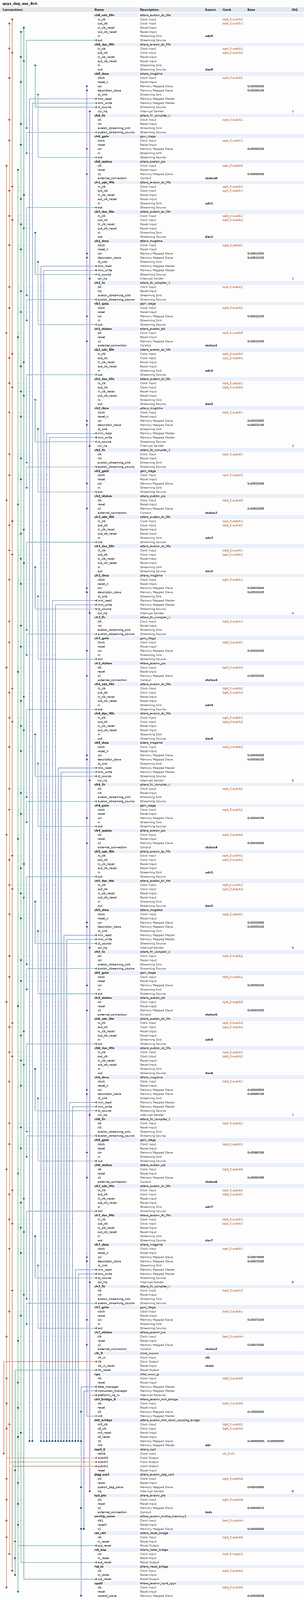
[diagram p0: system contents, whole]
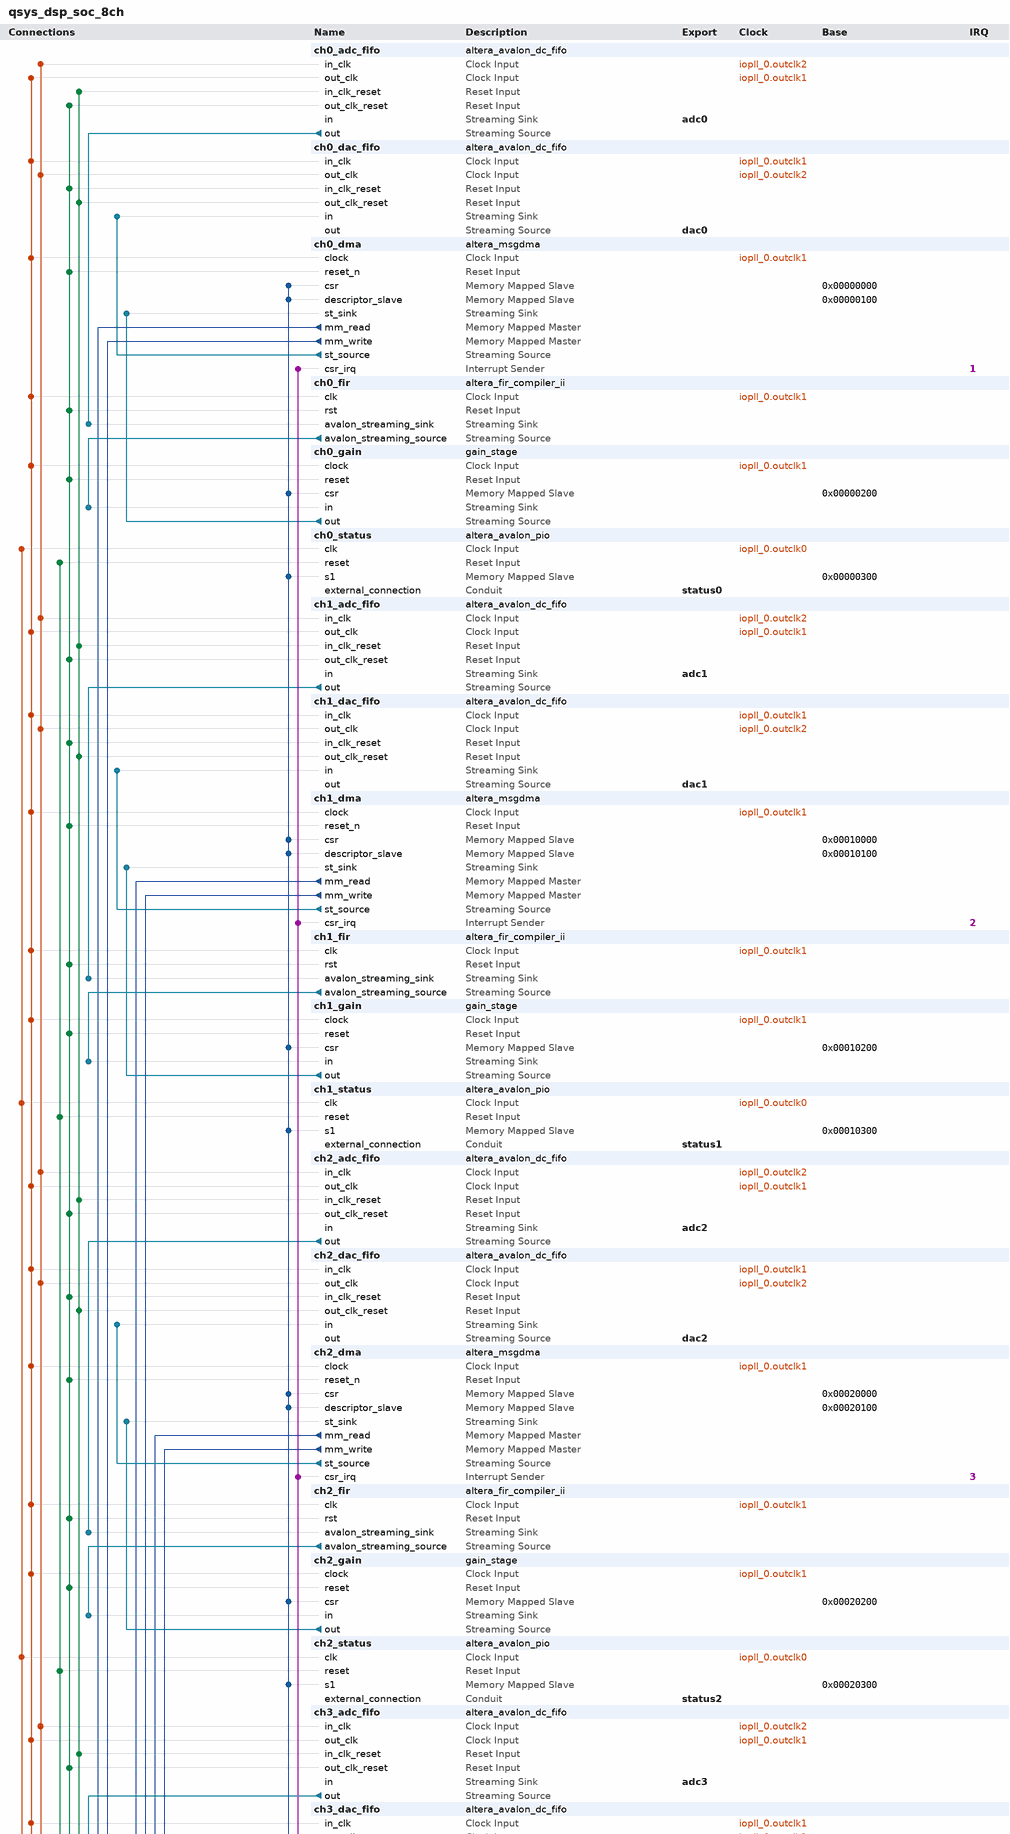
[diagram p1: system contents, upper part]
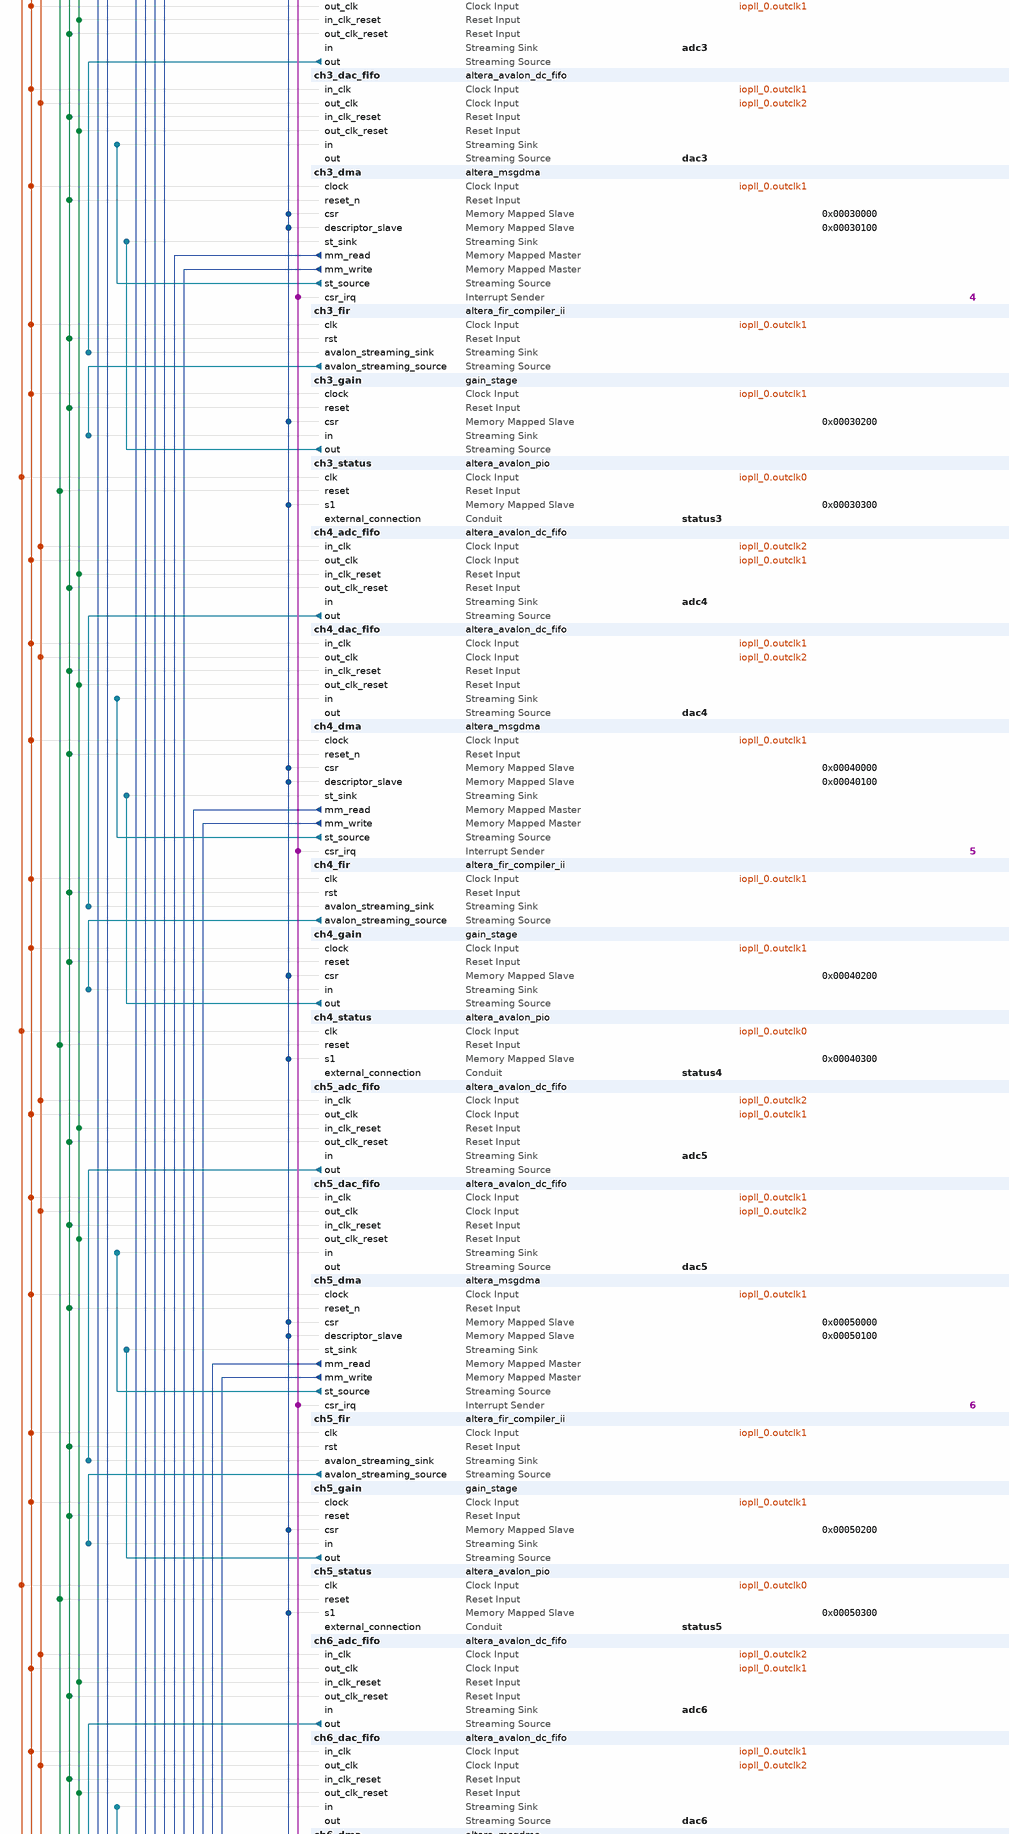
[diagram p2: system contents, middle part]
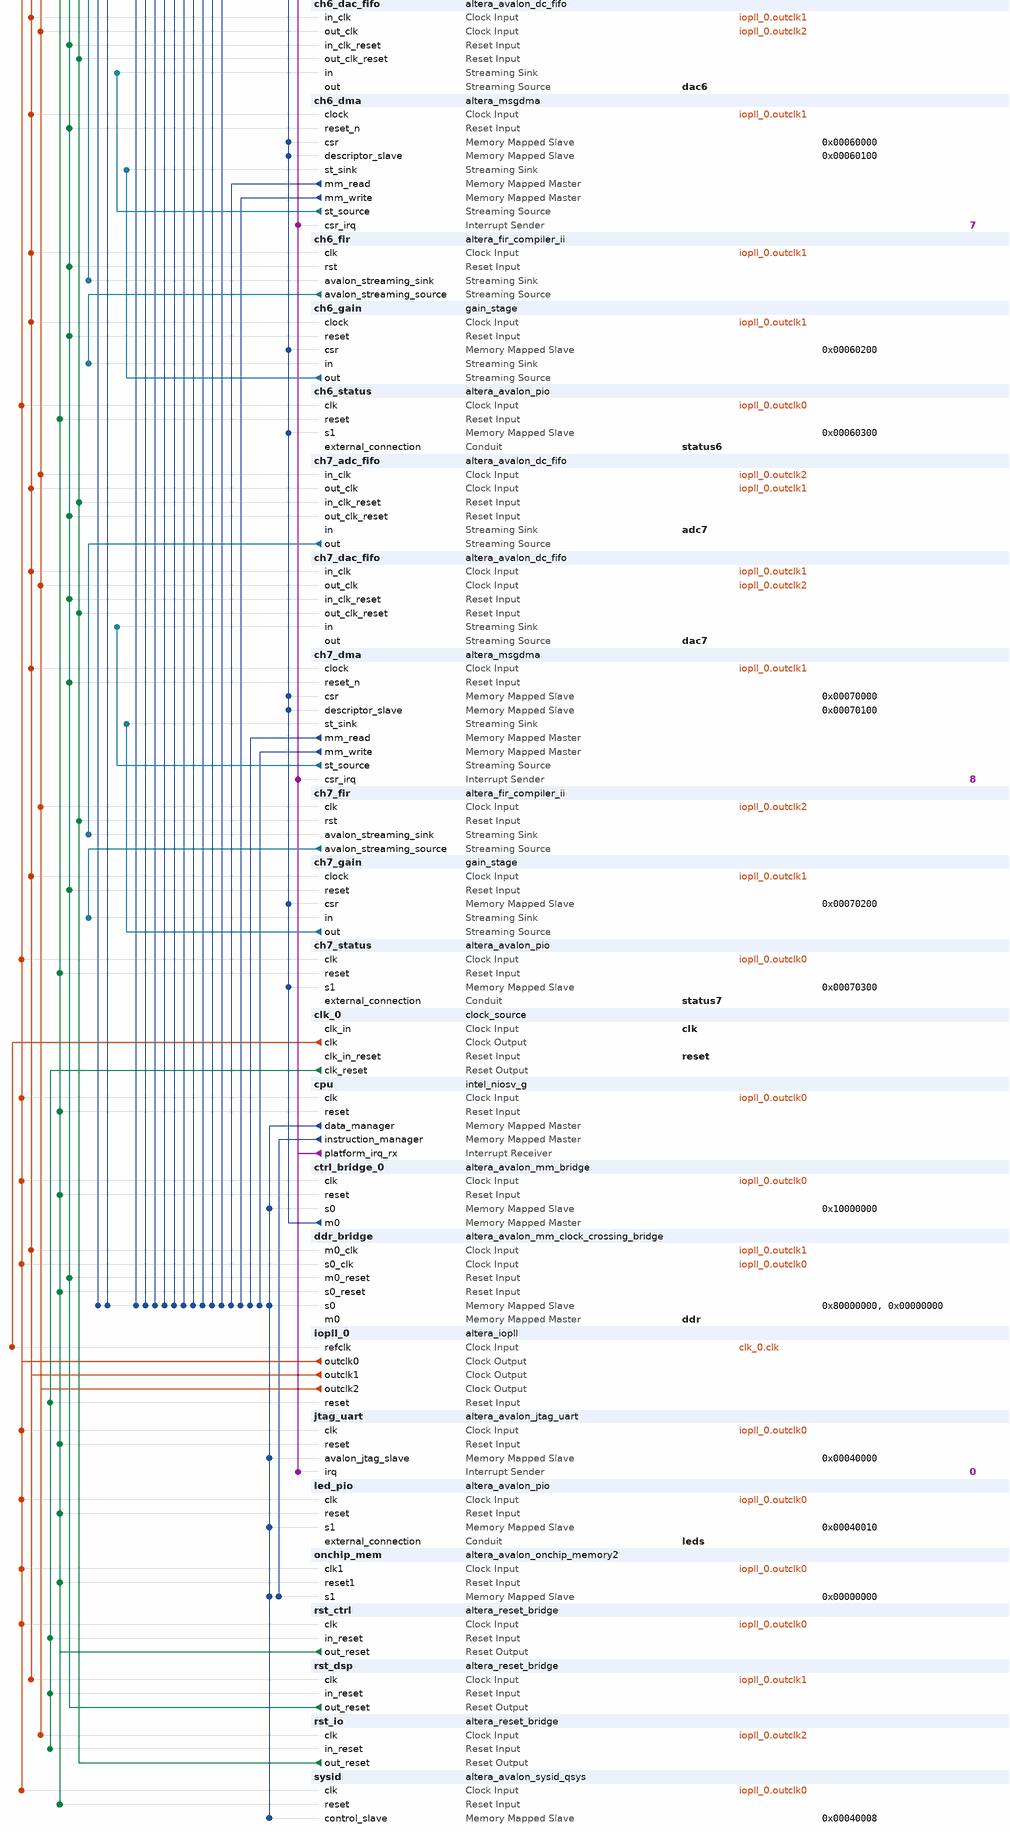
[diagram p3: system contents, lower part]
# Platform Designer (Qsys) system qsys_dsp_soc_8ch
# Parameters at their usual value, and those the tool derives, are not listed.
package require -exact qsys 23.1
create_system qsys_dsp_soc_8ch
set_project_property DEVICE_FAMILY {Agilex 7}

add_instance ch0_adc_fifo altera_avalon_dc_fifo 23.1
set_instance_parameter_value ch0_adc_fifo FIFO_DEPTH 512

add_instance ch0_dac_fifo altera_avalon_dc_fifo 23.1
set_instance_parameter_value ch0_dac_fifo FIFO_DEPTH 512

add_instance ch0_dma altera_msgdma 23.1
set_instance_parameter_value ch0_dma MODE 0
set_instance_parameter_value ch0_dma DATA_WIDTH 32

add_instance ch0_fir altera_fir_compiler_ii 23.1
set_instance_parameter_value ch0_fir inputBitWidth 16

add_instance ch0_gain gain_stage 1.0
set_instance_parameter_value ch0_gain GAIN_WIDTH 12

add_instance ch0_status altera_avalon_pio 23.1
set_instance_parameter_value ch0_status direction Input
set_instance_parameter_value ch0_status width 8

add_instance ch1_adc_fifo altera_avalon_dc_fifo 23.1
set_instance_parameter_value ch1_adc_fifo FIFO_DEPTH 512

add_instance ch1_dac_fifo altera_avalon_dc_fifo 23.1
set_instance_parameter_value ch1_dac_fifo FIFO_DEPTH 512

add_instance ch1_dma altera_msgdma 23.1
set_instance_parameter_value ch1_dma MODE 0
set_instance_parameter_value ch1_dma DATA_WIDTH 32

add_instance ch1_fir altera_fir_compiler_ii 23.1
set_instance_parameter_value ch1_fir inputBitWidth 16

add_instance ch1_gain gain_stage 1.0
set_instance_parameter_value ch1_gain GAIN_WIDTH 12

add_instance ch1_status altera_avalon_pio 23.1
set_instance_parameter_value ch1_status direction Input
set_instance_parameter_value ch1_status width 8

add_instance ch2_adc_fifo altera_avalon_dc_fifo 23.1
set_instance_parameter_value ch2_adc_fifo FIFO_DEPTH 512

add_instance ch2_dac_fifo altera_avalon_dc_fifo 23.1
set_instance_parameter_value ch2_dac_fifo FIFO_DEPTH 512

add_instance ch2_dma altera_msgdma 23.1
set_instance_parameter_value ch2_dma MODE 0
set_instance_parameter_value ch2_dma DATA_WIDTH 32

add_instance ch2_fir altera_fir_compiler_ii 23.1
set_instance_parameter_value ch2_fir inputBitWidth 16

add_instance ch2_gain gain_stage 1.0
set_instance_parameter_value ch2_gain GAIN_WIDTH 12

add_instance ch2_status altera_avalon_pio 23.1
set_instance_parameter_value ch2_status direction Input
set_instance_parameter_value ch2_status width 8

add_instance ch3_adc_fifo altera_avalon_dc_fifo 23.1
set_instance_parameter_value ch3_adc_fifo FIFO_DEPTH 512

add_instance ch3_dac_fifo altera_avalon_dc_fifo 23.1
set_instance_parameter_value ch3_dac_fifo FIFO_DEPTH 512

add_instance ch3_dma altera_msgdma 23.1
set_instance_parameter_value ch3_dma MODE 0
set_instance_parameter_value ch3_dma DATA_WIDTH 32

add_instance ch3_fir altera_fir_compiler_ii 23.1
set_instance_parameter_value ch3_fir inputBitWidth 16

add_instance ch3_gain gain_stage 1.0
set_instance_parameter_value ch3_gain GAIN_WIDTH 12

add_instance ch3_status altera_avalon_pio 23.1
set_instance_parameter_value ch3_status direction Input
set_instance_parameter_value ch3_status width 8

add_instance ch4_adc_fifo altera_avalon_dc_fifo 23.1
set_instance_parameter_value ch4_adc_fifo FIFO_DEPTH 512

add_instance ch4_dac_fifo altera_avalon_dc_fifo 23.1
set_instance_parameter_value ch4_dac_fifo FIFO_DEPTH 512

add_instance ch4_dma altera_msgdma 23.1
set_instance_parameter_value ch4_dma MODE 0
set_instance_parameter_value ch4_dma DATA_WIDTH 32

add_instance ch4_fir altera_fir_compiler_ii 23.1
set_instance_parameter_value ch4_fir inputBitWidth 16

add_instance ch4_gain gain_stage 1.0
set_instance_parameter_value ch4_gain GAIN_WIDTH 12

add_instance ch4_status altera_avalon_pio 23.1
set_instance_parameter_value ch4_status direction Input
set_instance_parameter_value ch4_status width 8

add_instance ch5_adc_fifo altera_avalon_dc_fifo 23.1
set_instance_parameter_value ch5_adc_fifo FIFO_DEPTH 512

add_instance ch5_dac_fifo altera_avalon_dc_fifo 23.1
set_instance_parameter_value ch5_dac_fifo FIFO_DEPTH 512

add_instance ch5_dma altera_msgdma 23.1
set_instance_parameter_value ch5_dma MODE 0
set_instance_parameter_value ch5_dma DATA_WIDTH 32

add_instance ch5_fir altera_fir_compiler_ii 23.1
set_instance_parameter_value ch5_fir inputBitWidth 16

add_instance ch5_gain gain_stage 1.0
set_instance_parameter_value ch5_gain GAIN_WIDTH 12

add_instance ch5_status altera_avalon_pio 23.1
set_instance_parameter_value ch5_status direction Input
set_instance_parameter_value ch5_status width 8

add_instance ch6_adc_fifo altera_avalon_dc_fifo 23.1
set_instance_parameter_value ch6_adc_fifo FIFO_DEPTH 512

add_instance ch6_dac_fifo altera_avalon_dc_fifo 23.1
set_instance_parameter_value ch6_dac_fifo FIFO_DEPTH 512

add_instance ch6_dma altera_msgdma 23.1
set_instance_parameter_value ch6_dma MODE 0
set_instance_parameter_value ch6_dma DATA_WIDTH 32

add_instance ch6_fir altera_fir_compiler_ii 23.1
set_instance_parameter_value ch6_fir inputBitWidth 16

add_instance ch6_gain gain_stage 1.0
set_instance_parameter_value ch6_gain GAIN_WIDTH 12

add_instance ch6_status altera_avalon_pio 23.1
set_instance_parameter_value ch6_status direction Input
set_instance_parameter_value ch6_status width 8

add_instance ch7_adc_fifo altera_avalon_dc_fifo 23.1
set_instance_parameter_value ch7_adc_fifo FIFO_DEPTH 512

add_instance ch7_dac_fifo altera_avalon_dc_fifo 23.1
set_instance_parameter_value ch7_dac_fifo FIFO_DEPTH 512

add_instance ch7_dma altera_msgdma 23.1
set_instance_parameter_value ch7_dma MODE 0
set_instance_parameter_value ch7_dma DATA_WIDTH 32

add_instance ch7_fir altera_fir_compiler_ii 23.1
set_instance_parameter_value ch7_fir inputBitWidth 16

add_instance ch7_gain gain_stage 1.0
set_instance_parameter_value ch7_gain GAIN_WIDTH 12

add_instance ch7_status altera_avalon_pio 23.1
set_instance_parameter_value ch7_status direction Input
set_instance_parameter_value ch7_status width 8

add_instance clk_0 clock_source 23.1
set_instance_parameter_value clk_0 clockFrequency 50000000

add_instance cpu intel_niosv_g 23.1
set_instance_parameter_value cpu resetSlave onchip_mem.s1

add_instance ctrl_bridge_0 altera_avalon_mm_bridge 23.1
set_instance_parameter_value ctrl_bridge_0 DATA_WIDTH 32

add_instance ddr_bridge altera_avalon_mm_clock_crossing_bridge 23.1
set_instance_parameter_value ddr_bridge DATA_WIDTH 128

add_instance iopll_0 altera_iopll 23.1
set_instance_parameter_value iopll_0 gui_number_of_clocks 3
set_instance_parameter_value iopll_0 gui_output_clock_frequency0 100
set_instance_parameter_value iopll_0 gui_output_clock_frequency1 250
set_instance_parameter_value iopll_0 gui_output_clock_frequency2 50

add_instance jtag_uart altera_avalon_jtag_uart 23.1

add_instance led_pio altera_avalon_pio 23.1
set_instance_parameter_value led_pio direction Output
set_instance_parameter_value led_pio width 8

add_instance onchip_mem altera_avalon_onchip_memory2 23.1
set_instance_parameter_value onchip_mem memorySize 262144

add_instance rst_ctrl altera_reset_bridge 23.1
set_instance_parameter_value rst_ctrl SYNCHRONOUS_EDGES deassert

add_instance rst_dsp altera_reset_bridge 23.1
set_instance_parameter_value rst_dsp SYNCHRONOUS_EDGES deassert

add_instance rst_io altera_reset_bridge 23.1
set_instance_parameter_value rst_io SYNCHRONOUS_EDGES deassert

add_instance sysid altera_avalon_sysid_qsys 23.1
set_instance_parameter_value sysid id 4660

# connections
add_connection clk_0.clk iopll_0.refclk clock
add_connection iopll_0.outclk0 ch0_status.clk clock
add_connection iopll_0.outclk0 ch1_status.clk clock
add_connection iopll_0.outclk0 ch2_status.clk clock
add_connection iopll_0.outclk0 ch3_status.clk clock
add_connection iopll_0.outclk0 ch4_status.clk clock
add_connection iopll_0.outclk0 ch5_status.clk clock
add_connection iopll_0.outclk0 ch6_status.clk clock
add_connection iopll_0.outclk0 ch7_status.clk clock
add_connection iopll_0.outclk0 cpu.clk clock
add_connection iopll_0.outclk0 ctrl_bridge_0.clk clock
add_connection iopll_0.outclk0 ddr_bridge.s0_clk clock
add_connection iopll_0.outclk0 jtag_uart.clk clock
add_connection iopll_0.outclk0 led_pio.clk clock
add_connection iopll_0.outclk0 onchip_mem.clk1 clock
add_connection iopll_0.outclk0 rst_ctrl.clk clock
add_connection iopll_0.outclk0 sysid.clk clock
add_connection iopll_0.outclk1 ch0_adc_fifo.out_clk clock
add_connection iopll_0.outclk1 ch0_dac_fifo.in_clk clock
add_connection iopll_0.outclk1 ch0_dma.clock clock
add_connection iopll_0.outclk1 ch0_fir.clk clock
add_connection iopll_0.outclk1 ch0_gain.clock clock
add_connection iopll_0.outclk1 ch1_adc_fifo.out_clk clock
add_connection iopll_0.outclk1 ch1_dac_fifo.in_clk clock
add_connection iopll_0.outclk1 ch1_dma.clock clock
add_connection iopll_0.outclk1 ch1_fir.clk clock
add_connection iopll_0.outclk1 ch1_gain.clock clock
add_connection iopll_0.outclk1 ch2_adc_fifo.out_clk clock
add_connection iopll_0.outclk1 ch2_dac_fifo.in_clk clock
add_connection iopll_0.outclk1 ch2_dma.clock clock
add_connection iopll_0.outclk1 ch2_fir.clk clock
add_connection iopll_0.outclk1 ch2_gain.clock clock
add_connection iopll_0.outclk1 ch3_adc_fifo.out_clk clock
add_connection iopll_0.outclk1 ch3_dac_fifo.in_clk clock
add_connection iopll_0.outclk1 ch3_dma.clock clock
add_connection iopll_0.outclk1 ch3_fir.clk clock
add_connection iopll_0.outclk1 ch3_gain.clock clock
add_connection iopll_0.outclk1 ch4_adc_fifo.out_clk clock
add_connection iopll_0.outclk1 ch4_dac_fifo.in_clk clock
add_connection iopll_0.outclk1 ch4_dma.clock clock
add_connection iopll_0.outclk1 ch4_fir.clk clock
add_connection iopll_0.outclk1 ch4_gain.clock clock
add_connection iopll_0.outclk1 ch5_adc_fifo.out_clk clock
add_connection iopll_0.outclk1 ch5_dac_fifo.in_clk clock
add_connection iopll_0.outclk1 ch5_dma.clock clock
add_connection iopll_0.outclk1 ch5_fir.clk clock
add_connection iopll_0.outclk1 ch5_gain.clock clock
add_connection iopll_0.outclk1 ch6_adc_fifo.out_clk clock
add_connection iopll_0.outclk1 ch6_dac_fifo.in_clk clock
add_connection iopll_0.outclk1 ch6_dma.clock clock
add_connection iopll_0.outclk1 ch6_fir.clk clock
add_connection iopll_0.outclk1 ch6_gain.clock clock
add_connection iopll_0.outclk1 ch7_adc_fifo.out_clk clock
add_connection iopll_0.outclk1 ch7_dac_fifo.in_clk clock
add_connection iopll_0.outclk1 ch7_dma.clock clock
add_connection iopll_0.outclk1 ch7_gain.clock clock
add_connection iopll_0.outclk1 ddr_bridge.m0_clk clock
add_connection iopll_0.outclk1 rst_dsp.clk clock
add_connection iopll_0.outclk2 ch0_adc_fifo.in_clk clock
add_connection iopll_0.outclk2 ch0_dac_fifo.out_clk clock
add_connection iopll_0.outclk2 ch1_adc_fifo.in_clk clock
add_connection iopll_0.outclk2 ch1_dac_fifo.out_clk clock
add_connection iopll_0.outclk2 ch2_adc_fifo.in_clk clock
add_connection iopll_0.outclk2 ch2_dac_fifo.out_clk clock
add_connection iopll_0.outclk2 ch3_adc_fifo.in_clk clock
add_connection iopll_0.outclk2 ch3_dac_fifo.out_clk clock
add_connection iopll_0.outclk2 ch4_adc_fifo.in_clk clock
add_connection iopll_0.outclk2 ch4_dac_fifo.out_clk clock
add_connection iopll_0.outclk2 ch5_adc_fifo.in_clk clock
add_connection iopll_0.outclk2 ch5_dac_fifo.out_clk clock
add_connection iopll_0.outclk2 ch6_adc_fifo.in_clk clock
add_connection iopll_0.outclk2 ch6_dac_fifo.out_clk clock
add_connection iopll_0.outclk2 ch7_adc_fifo.in_clk clock
add_connection iopll_0.outclk2 ch7_dac_fifo.out_clk clock
add_connection iopll_0.outclk2 ch7_fir.clk clock
add_connection iopll_0.outclk2 rst_io.clk clock
add_connection clk_0.clk_reset iopll_0.reset reset
add_connection clk_0.clk_reset rst_ctrl.in_reset reset
add_connection clk_0.clk_reset rst_dsp.in_reset reset
add_connection clk_0.clk_reset rst_io.in_reset reset
add_connection rst_ctrl.out_reset ch0_status.reset reset
add_connection rst_ctrl.out_reset ch1_status.reset reset
add_connection rst_ctrl.out_reset ch2_status.reset reset
add_connection rst_ctrl.out_reset ch3_status.reset reset
add_connection rst_ctrl.out_reset ch4_status.reset reset
add_connection rst_ctrl.out_reset ch5_status.reset reset
add_connection rst_ctrl.out_reset ch6_status.reset reset
add_connection rst_ctrl.out_reset ch7_status.reset reset
add_connection rst_ctrl.out_reset cpu.reset reset
add_connection rst_ctrl.out_reset ctrl_bridge_0.reset reset
add_connection rst_ctrl.out_reset ddr_bridge.s0_reset reset
add_connection rst_ctrl.out_reset jtag_uart.reset reset
add_connection rst_ctrl.out_reset led_pio.reset reset
add_connection rst_ctrl.out_reset onchip_mem.reset1 reset
add_connection rst_ctrl.out_reset sysid.reset reset
add_connection rst_dsp.out_reset ch0_adc_fifo.out_clk_reset reset
add_connection rst_dsp.out_reset ch0_dac_fifo.in_clk_reset reset
add_connection rst_dsp.out_reset ch0_dma.reset_n reset
add_connection rst_dsp.out_reset ch0_fir.rst reset
add_connection rst_dsp.out_reset ch0_gain.reset reset
add_connection rst_dsp.out_reset ch1_adc_fifo.out_clk_reset reset
add_connection rst_dsp.out_reset ch1_dac_fifo.in_clk_reset reset
add_connection rst_dsp.out_reset ch1_dma.reset_n reset
add_connection rst_dsp.out_reset ch1_fir.rst reset
add_connection rst_dsp.out_reset ch1_gain.reset reset
add_connection rst_dsp.out_reset ch2_adc_fifo.out_clk_reset reset
add_connection rst_dsp.out_reset ch2_dac_fifo.in_clk_reset reset
add_connection rst_dsp.out_reset ch2_dma.reset_n reset
add_connection rst_dsp.out_reset ch2_fir.rst reset
add_connection rst_dsp.out_reset ch2_gain.reset reset
add_connection rst_dsp.out_reset ch3_adc_fifo.out_clk_reset reset
add_connection rst_dsp.out_reset ch3_dac_fifo.in_clk_reset reset
add_connection rst_dsp.out_reset ch3_dma.reset_n reset
add_connection rst_dsp.out_reset ch3_fir.rst reset
add_connection rst_dsp.out_reset ch3_gain.reset reset
add_connection rst_dsp.out_reset ch4_adc_fifo.out_clk_reset reset
add_connection rst_dsp.out_reset ch4_dac_fifo.in_clk_reset reset
add_connection rst_dsp.out_reset ch4_dma.reset_n reset
add_connection rst_dsp.out_reset ch4_fir.rst reset
add_connection rst_dsp.out_reset ch4_gain.reset reset
add_connection rst_dsp.out_reset ch5_adc_fifo.out_clk_reset reset
add_connection rst_dsp.out_reset ch5_dac_fifo.in_clk_reset reset
add_connection rst_dsp.out_reset ch5_dma.reset_n reset
add_connection rst_dsp.out_reset ch5_fir.rst reset
add_connection rst_dsp.out_reset ch5_gain.reset reset
add_connection rst_dsp.out_reset ch6_adc_fifo.out_clk_reset reset
add_connection rst_dsp.out_reset ch6_dac_fifo.in_clk_reset reset
add_connection rst_dsp.out_reset ch6_dma.reset_n reset
add_connection rst_dsp.out_reset ch6_fir.rst reset
add_connection rst_dsp.out_reset ch6_gain.reset reset
add_connection rst_dsp.out_reset ch7_adc_fifo.out_clk_reset reset
add_connection rst_dsp.out_reset ch7_dac_fifo.in_clk_reset reset
add_connection rst_dsp.out_reset ch7_dma.reset_n reset
add_connection rst_dsp.out_reset ch7_gain.reset reset
add_connection rst_dsp.out_reset ddr_bridge.m0_reset reset
add_connection rst_io.out_reset ch0_adc_fifo.in_clk_reset reset
add_connection rst_io.out_reset ch0_dac_fifo.out_clk_reset reset
add_connection rst_io.out_reset ch1_adc_fifo.in_clk_reset reset
add_connection rst_io.out_reset ch1_dac_fifo.out_clk_reset reset
add_connection rst_io.out_reset ch2_adc_fifo.in_clk_reset reset
add_connection rst_io.out_reset ch2_dac_fifo.out_clk_reset reset
add_connection rst_io.out_reset ch3_adc_fifo.in_clk_reset reset
add_connection rst_io.out_reset ch3_dac_fifo.out_clk_reset reset
add_connection rst_io.out_reset ch4_adc_fifo.in_clk_reset reset
add_connection rst_io.out_reset ch4_dac_fifo.out_clk_reset reset
add_connection rst_io.out_reset ch5_adc_fifo.in_clk_reset reset
add_connection rst_io.out_reset ch5_dac_fifo.out_clk_reset reset
add_connection rst_io.out_reset ch6_adc_fifo.in_clk_reset reset
add_connection rst_io.out_reset ch6_dac_fifo.out_clk_reset reset
add_connection rst_io.out_reset ch7_adc_fifo.in_clk_reset reset
add_connection rst_io.out_reset ch7_dac_fifo.out_clk_reset reset
add_connection rst_io.out_reset ch7_fir.rst reset
add_connection ch0_dma.mm_read ddr_bridge.s0 avalon
set_connection_parameter_value ch0_dma.mm_read/ddr_bridge.s0 baseAddress 0x00000000
add_connection ch0_dma.mm_write ddr_bridge.s0 avalon
set_connection_parameter_value ch0_dma.mm_write/ddr_bridge.s0 baseAddress 0x00000000
add_connection ch1_dma.mm_read ddr_bridge.s0 avalon
set_connection_parameter_value ch1_dma.mm_read/ddr_bridge.s0 baseAddress 0x00000000
add_connection ch1_dma.mm_write ddr_bridge.s0 avalon
set_connection_parameter_value ch1_dma.mm_write/ddr_bridge.s0 baseAddress 0x00000000
add_connection ch2_dma.mm_read ddr_bridge.s0 avalon
set_connection_parameter_value ch2_dma.mm_read/ddr_bridge.s0 baseAddress 0x00000000
add_connection ch2_dma.mm_write ddr_bridge.s0 avalon
set_connection_parameter_value ch2_dma.mm_write/ddr_bridge.s0 baseAddress 0x00000000
add_connection ch3_dma.mm_read ddr_bridge.s0 avalon
set_connection_parameter_value ch3_dma.mm_read/ddr_bridge.s0 baseAddress 0x00000000
add_connection ch3_dma.mm_write ddr_bridge.s0 avalon
set_connection_parameter_value ch3_dma.mm_write/ddr_bridge.s0 baseAddress 0x00000000
add_connection ch4_dma.mm_read ddr_bridge.s0 avalon
set_connection_parameter_value ch4_dma.mm_read/ddr_bridge.s0 baseAddress 0x00000000
add_connection ch4_dma.mm_write ddr_bridge.s0 avalon
set_connection_parameter_value ch4_dma.mm_write/ddr_bridge.s0 baseAddress 0x00000000
add_connection ch5_dma.mm_read ddr_bridge.s0 avalon
set_connection_parameter_value ch5_dma.mm_read/ddr_bridge.s0 baseAddress 0x00000000
add_connection ch5_dma.mm_write ddr_bridge.s0 avalon
set_connection_parameter_value ch5_dma.mm_write/ddr_bridge.s0 baseAddress 0x00000000
add_connection ch6_dma.mm_read ddr_bridge.s0 avalon
set_connection_parameter_value ch6_dma.mm_read/ddr_bridge.s0 baseAddress 0x00000000
add_connection ch6_dma.mm_write ddr_bridge.s0 avalon
set_connection_parameter_value ch6_dma.mm_write/ddr_bridge.s0 baseAddress 0x00000000
add_connection ch7_dma.mm_read ddr_bridge.s0 avalon
set_connection_parameter_value ch7_dma.mm_read/ddr_bridge.s0 baseAddress 0x00000000
add_connection ch7_dma.mm_write ddr_bridge.s0 avalon
set_connection_parameter_value ch7_dma.mm_write/ddr_bridge.s0 baseAddress 0x00000000
add_connection cpu.data_manager ctrl_bridge_0.s0 avalon
set_connection_parameter_value cpu.data_manager/ctrl_bridge_0.s0 baseAddress 0x10000000
add_connection cpu.data_manager ddr_bridge.s0 avalon
set_connection_parameter_value cpu.data_manager/ddr_bridge.s0 baseAddress 0x80000000
add_connection cpu.data_manager jtag_uart.avalon_jtag_slave avalon
set_connection_parameter_value cpu.data_manager/jtag_uart.avalon_jtag_slave baseAddress 0x00040000
add_connection cpu.data_manager led_pio.s1 avalon
set_connection_parameter_value cpu.data_manager/led_pio.s1 baseAddress 0x00040010
add_connection cpu.data_manager onchip_mem.s1 avalon
set_connection_parameter_value cpu.data_manager/onchip_mem.s1 baseAddress 0x00000000
add_connection cpu.data_manager sysid.control_slave avalon
set_connection_parameter_value cpu.data_manager/sysid.control_slave baseAddress 0x00040008
add_connection cpu.instruction_manager onchip_mem.s1 avalon
set_connection_parameter_value cpu.instruction_manager/onchip_mem.s1 baseAddress 0x00000000
add_connection ctrl_bridge_0.m0 ch0_dma.csr avalon
set_connection_parameter_value ctrl_bridge_0.m0/ch0_dma.csr baseAddress 0x00000000
add_connection ctrl_bridge_0.m0 ch0_dma.descriptor_slave avalon
set_connection_parameter_value ctrl_bridge_0.m0/ch0_dma.descriptor_slave baseAddress 0x00000100
add_connection ctrl_bridge_0.m0 ch0_gain.csr avalon
set_connection_parameter_value ctrl_bridge_0.m0/ch0_gain.csr baseAddress 0x00000200
add_connection ctrl_bridge_0.m0 ch0_status.s1 avalon
set_connection_parameter_value ctrl_bridge_0.m0/ch0_status.s1 baseAddress 0x00000300
add_connection ctrl_bridge_0.m0 ch1_dma.csr avalon
set_connection_parameter_value ctrl_bridge_0.m0/ch1_dma.csr baseAddress 0x00010000
add_connection ctrl_bridge_0.m0 ch1_dma.descriptor_slave avalon
set_connection_parameter_value ctrl_bridge_0.m0/ch1_dma.descriptor_slave baseAddress 0x00010100
add_connection ctrl_bridge_0.m0 ch1_gain.csr avalon
set_connection_parameter_value ctrl_bridge_0.m0/ch1_gain.csr baseAddress 0x00010200
add_connection ctrl_bridge_0.m0 ch1_status.s1 avalon
set_connection_parameter_value ctrl_bridge_0.m0/ch1_status.s1 baseAddress 0x00010300
add_connection ctrl_bridge_0.m0 ch2_dma.csr avalon
set_connection_parameter_value ctrl_bridge_0.m0/ch2_dma.csr baseAddress 0x00020000
add_connection ctrl_bridge_0.m0 ch2_dma.descriptor_slave avalon
set_connection_parameter_value ctrl_bridge_0.m0/ch2_dma.descriptor_slave baseAddress 0x00020100
add_connection ctrl_bridge_0.m0 ch2_gain.csr avalon
set_connection_parameter_value ctrl_bridge_0.m0/ch2_gain.csr baseAddress 0x00020200
add_connection ctrl_bridge_0.m0 ch2_status.s1 avalon
set_connection_parameter_value ctrl_bridge_0.m0/ch2_status.s1 baseAddress 0x00020300
add_connection ctrl_bridge_0.m0 ch3_dma.csr avalon
set_connection_parameter_value ctrl_bridge_0.m0/ch3_dma.csr baseAddress 0x00030000
add_connection ctrl_bridge_0.m0 ch3_dma.descriptor_slave avalon
set_connection_parameter_value ctrl_bridge_0.m0/ch3_dma.descriptor_slave baseAddress 0x00030100
add_connection ctrl_bridge_0.m0 ch3_gain.csr avalon
set_connection_parameter_value ctrl_bridge_0.m0/ch3_gain.csr baseAddress 0x00030200
add_connection ctrl_bridge_0.m0 ch3_status.s1 avalon
set_connection_parameter_value ctrl_bridge_0.m0/ch3_status.s1 baseAddress 0x00030300
add_connection ctrl_bridge_0.m0 ch4_dma.csr avalon
set_connection_parameter_value ctrl_bridge_0.m0/ch4_dma.csr baseAddress 0x00040000
add_connection ctrl_bridge_0.m0 ch4_dma.descriptor_slave avalon
set_connection_parameter_value ctrl_bridge_0.m0/ch4_dma.descriptor_slave baseAddress 0x00040100
add_connection ctrl_bridge_0.m0 ch4_gain.csr avalon
set_connection_parameter_value ctrl_bridge_0.m0/ch4_gain.csr baseAddress 0x00040200
add_connection ctrl_bridge_0.m0 ch4_status.s1 avalon
set_connection_parameter_value ctrl_bridge_0.m0/ch4_status.s1 baseAddress 0x00040300
add_connection ctrl_bridge_0.m0 ch5_dma.csr avalon
set_connection_parameter_value ctrl_bridge_0.m0/ch5_dma.csr baseAddress 0x00050000
add_connection ctrl_bridge_0.m0 ch5_dma.descriptor_slave avalon
set_connection_parameter_value ctrl_bridge_0.m0/ch5_dma.descriptor_slave baseAddress 0x00050100
add_connection ctrl_bridge_0.m0 ch5_gain.csr avalon
set_connection_parameter_value ctrl_bridge_0.m0/ch5_gain.csr baseAddress 0x00050200
add_connection ctrl_bridge_0.m0 ch5_status.s1 avalon
set_connection_parameter_value ctrl_bridge_0.m0/ch5_status.s1 baseAddress 0x00050300
add_connection ctrl_bridge_0.m0 ch6_dma.csr avalon
set_connection_parameter_value ctrl_bridge_0.m0/ch6_dma.csr baseAddress 0x00060000
add_connection ctrl_bridge_0.m0 ch6_dma.descriptor_slave avalon
set_connection_parameter_value ctrl_bridge_0.m0/ch6_dma.descriptor_slave baseAddress 0x00060100
add_connection ctrl_bridge_0.m0 ch6_gain.csr avalon
set_connection_parameter_value ctrl_bridge_0.m0/ch6_gain.csr baseAddress 0x00060200
add_connection ctrl_bridge_0.m0 ch6_status.s1 avalon
set_connection_parameter_value ctrl_bridge_0.m0/ch6_status.s1 baseAddress 0x00060300
add_connection ctrl_bridge_0.m0 ch7_dma.csr avalon
set_connection_parameter_value ctrl_bridge_0.m0/ch7_dma.csr baseAddress 0x00070000
add_connection ctrl_bridge_0.m0 ch7_dma.descriptor_slave avalon
set_connection_parameter_value ctrl_bridge_0.m0/ch7_dma.descriptor_slave baseAddress 0x00070100
add_connection ctrl_bridge_0.m0 ch7_gain.csr avalon
set_connection_parameter_value ctrl_bridge_0.m0/ch7_gain.csr baseAddress 0x00070200
add_connection ctrl_bridge_0.m0 ch7_status.s1 avalon
set_connection_parameter_value ctrl_bridge_0.m0/ch7_status.s1 baseAddress 0x00070300
add_connection ch0_adc_fifo.out ch0_fir.avalon_streaming_sink avalon_streaming
add_connection ch0_dma.st_source ch0_dac_fifo.in avalon_streaming
add_connection ch0_fir.avalon_streaming_source ch0_gain.in avalon_streaming
add_connection ch0_gain.out ch0_dma.st_sink avalon_streaming
add_connection ch1_adc_fifo.out ch1_fir.avalon_streaming_sink avalon_streaming
add_connection ch1_dma.st_source ch1_dac_fifo.in avalon_streaming
add_connection ch1_fir.avalon_streaming_source ch1_gain.in avalon_streaming
add_connection ch1_gain.out ch1_dma.st_sink avalon_streaming
add_connection ch2_adc_fifo.out ch2_fir.avalon_streaming_sink avalon_streaming
add_connection ch2_dma.st_source ch2_dac_fifo.in avalon_streaming
add_connection ch2_fir.avalon_streaming_source ch2_gain.in avalon_streaming
add_connection ch2_gain.out ch2_dma.st_sink avalon_streaming
add_connection ch3_adc_fifo.out ch3_fir.avalon_streaming_sink avalon_streaming
add_connection ch3_dma.st_source ch3_dac_fifo.in avalon_streaming
add_connection ch3_fir.avalon_streaming_source ch3_gain.in avalon_streaming
add_connection ch3_gain.out ch3_dma.st_sink avalon_streaming
add_connection ch4_adc_fifo.out ch4_fir.avalon_streaming_sink avalon_streaming
add_connection ch4_dma.st_source ch4_dac_fifo.in avalon_streaming
add_connection ch4_fir.avalon_streaming_source ch4_gain.in avalon_streaming
add_connection ch4_gain.out ch4_dma.st_sink avalon_streaming
add_connection ch5_adc_fifo.out ch5_fir.avalon_streaming_sink avalon_streaming
add_connection ch5_dma.st_source ch5_dac_fifo.in avalon_streaming
add_connection ch5_fir.avalon_streaming_source ch5_gain.in avalon_streaming
add_connection ch5_gain.out ch5_dma.st_sink avalon_streaming
add_connection ch6_adc_fifo.out ch6_fir.avalon_streaming_sink avalon_streaming
add_connection ch6_dma.st_source ch6_dac_fifo.in avalon_streaming
add_connection ch6_fir.avalon_streaming_source ch6_gain.in avalon_streaming
add_connection ch6_gain.out ch6_dma.st_sink avalon_streaming
add_connection ch7_adc_fifo.out ch7_fir.avalon_streaming_sink avalon_streaming
add_connection ch7_dma.st_source ch7_dac_fifo.in avalon_streaming
add_connection ch7_fir.avalon_streaming_source ch7_gain.in avalon_streaming
add_connection ch7_gain.out ch7_dma.st_sink avalon_streaming
add_connection cpu.platform_irq_rx ch0_dma.csr_irq interrupt
set_connection_parameter_value cpu.platform_irq_rx/ch0_dma.csr_irq irqNumber 1
add_connection cpu.platform_irq_rx ch1_dma.csr_irq interrupt
set_connection_parameter_value cpu.platform_irq_rx/ch1_dma.csr_irq irqNumber 2
add_connection cpu.platform_irq_rx ch2_dma.csr_irq interrupt
set_connection_parameter_value cpu.platform_irq_rx/ch2_dma.csr_irq irqNumber 3
add_connection cpu.platform_irq_rx ch3_dma.csr_irq interrupt
set_connection_parameter_value cpu.platform_irq_rx/ch3_dma.csr_irq irqNumber 4
add_connection cpu.platform_irq_rx ch4_dma.csr_irq interrupt
set_connection_parameter_value cpu.platform_irq_rx/ch4_dma.csr_irq irqNumber 5
add_connection cpu.platform_irq_rx ch5_dma.csr_irq interrupt
set_connection_parameter_value cpu.platform_irq_rx/ch5_dma.csr_irq irqNumber 6
add_connection cpu.platform_irq_rx ch6_dma.csr_irq interrupt
set_connection_parameter_value cpu.platform_irq_rx/ch6_dma.csr_irq irqNumber 7
add_connection cpu.platform_irq_rx ch7_dma.csr_irq interrupt
set_connection_parameter_value cpu.platform_irq_rx/ch7_dma.csr_irq irqNumber 8
add_connection cpu.platform_irq_rx jtag_uart.irq interrupt
set_connection_parameter_value cpu.platform_irq_rx/jtag_uart.irq irqNumber 0

# exported interfaces
add_interface clk clock sink
set_interface_property clk EXPORT_OF clk_0.clk_in
add_interface reset reset sink
set_interface_property reset EXPORT_OF clk_0.clk_in_reset
add_interface leds conduit end
set_interface_property leds EXPORT_OF led_pio.external_connection
add_interface ddr avalon master
set_interface_property ddr EXPORT_OF ddr_bridge.m0
add_interface adc0 avalon_streaming sink
set_interface_property adc0 EXPORT_OF ch0_adc_fifo.in
add_interface dac0 avalon_streaming source
set_interface_property dac0 EXPORT_OF ch0_dac_fifo.out
add_interface status0 conduit end
set_interface_property status0 EXPORT_OF ch0_status.external_connection
add_interface adc1 avalon_streaming sink
set_interface_property adc1 EXPORT_OF ch1_adc_fifo.in
add_interface dac1 avalon_streaming source
set_interface_property dac1 EXPORT_OF ch1_dac_fifo.out
add_interface status1 conduit end
set_interface_property status1 EXPORT_OF ch1_status.external_connection
add_interface adc2 avalon_streaming sink
set_interface_property adc2 EXPORT_OF ch2_adc_fifo.in
add_interface dac2 avalon_streaming source
set_interface_property dac2 EXPORT_OF ch2_dac_fifo.out
add_interface status2 conduit end
set_interface_property status2 EXPORT_OF ch2_status.external_connection
add_interface adc3 avalon_streaming sink
set_interface_property adc3 EXPORT_OF ch3_adc_fifo.in
add_interface dac3 avalon_streaming source
set_interface_property dac3 EXPORT_OF ch3_dac_fifo.out
add_interface status3 conduit end
set_interface_property status3 EXPORT_OF ch3_status.external_connection
add_interface adc4 avalon_streaming sink
set_interface_property adc4 EXPORT_OF ch4_adc_fifo.in
add_interface dac4 avalon_streaming source
set_interface_property dac4 EXPORT_OF ch4_dac_fifo.out
add_interface status4 conduit end
set_interface_property status4 EXPORT_OF ch4_status.external_connection
add_interface adc5 avalon_streaming sink
set_interface_property adc5 EXPORT_OF ch5_adc_fifo.in
add_interface dac5 avalon_streaming source
set_interface_property dac5 EXPORT_OF ch5_dac_fifo.out
add_interface status5 conduit end
set_interface_property status5 EXPORT_OF ch5_status.external_connection
add_interface adc6 avalon_streaming sink
set_interface_property adc6 EXPORT_OF ch6_adc_fifo.in
add_interface dac6 avalon_streaming source
set_interface_property dac6 EXPORT_OF ch6_dac_fifo.out
add_interface status6 conduit end
set_interface_property status6 EXPORT_OF ch6_status.external_connection
add_interface adc7 avalon_streaming sink
set_interface_property adc7 EXPORT_OF ch7_adc_fifo.in
add_interface dac7 avalon_streaming source
set_interface_property dac7 EXPORT_OF ch7_dac_fifo.out
add_interface status7 conduit end
set_interface_property status7 EXPORT_OF ch7_status.external_connection

save_system qsys_dsp_soc_8ch.qsys
